# Altium schematic sheet Block_Bus_PC104.SchDoc
size A4; SheetNumber: 5; SheetTotal: 5
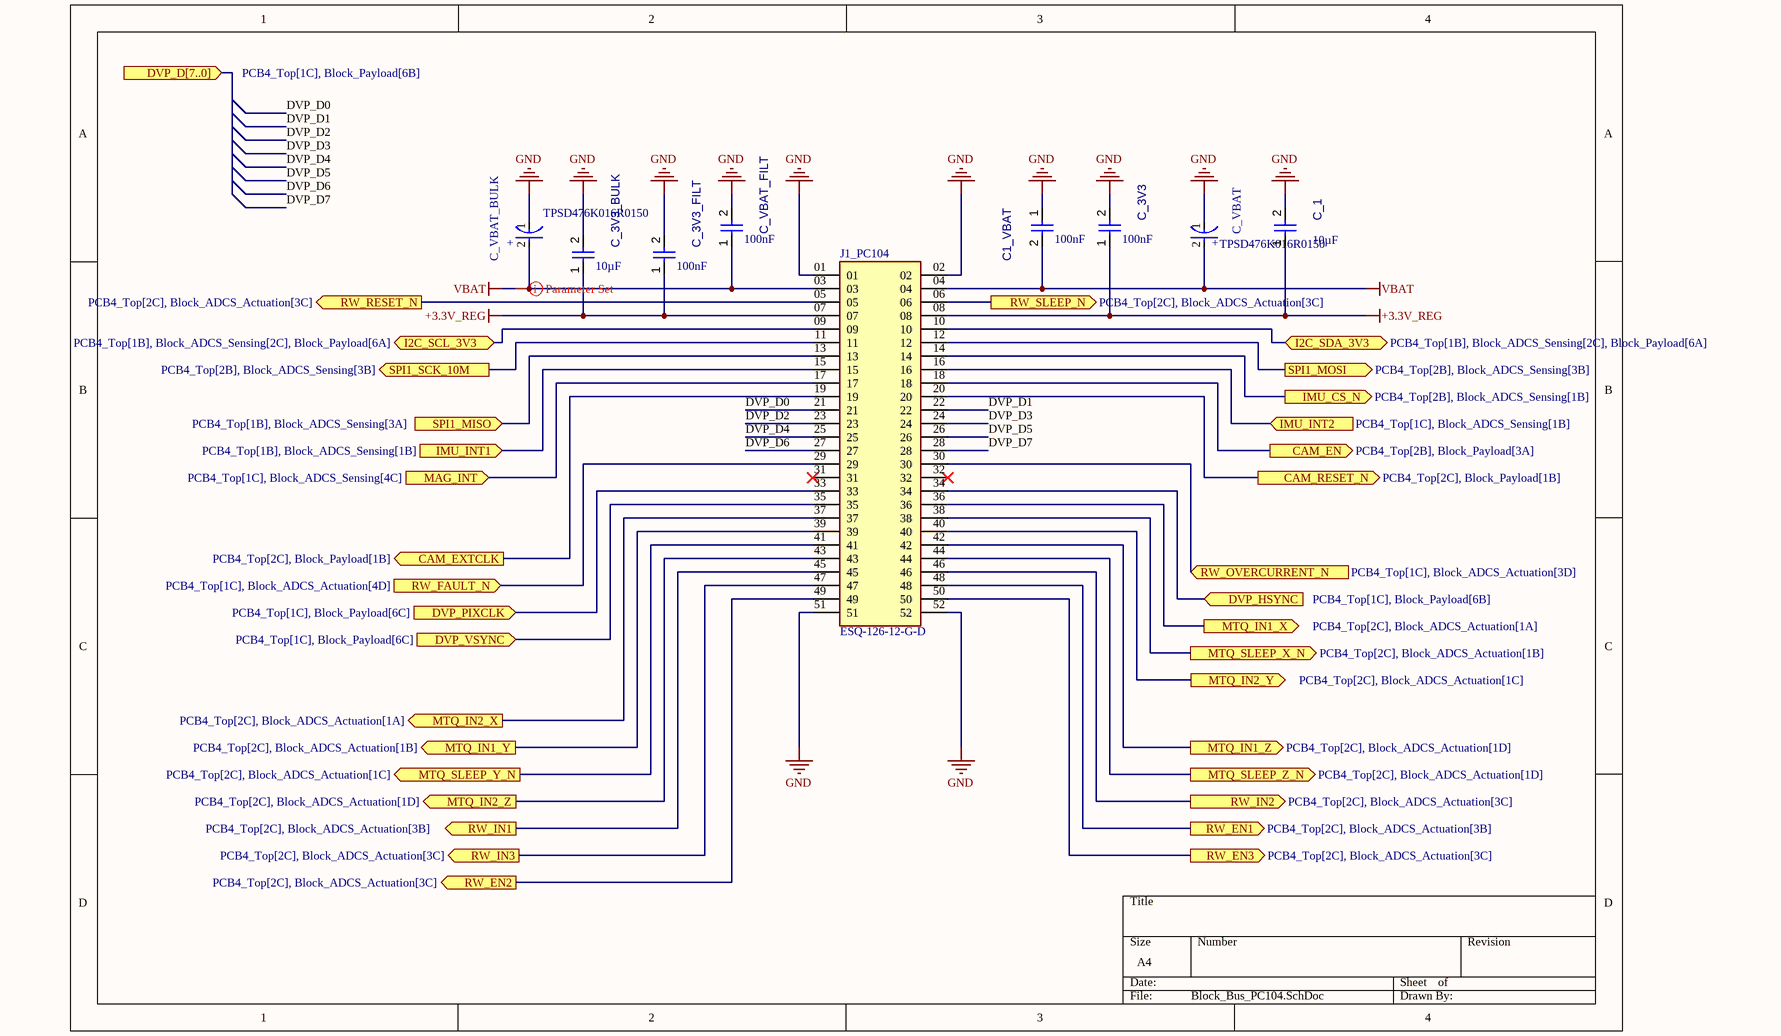
[diagram p0: Block_Bus_PC104.SchDoc]

## Parts
C1_VBAT  value 100nF  [CAPC1608X90X40NL10T20]  (hidden comment: Capacitor 100 nF +/-10% 50 V 0603)
C_1  value 10µF  [CAPC2013X135X45NL10T25]  (hidden comment: Capacitor 10 uF +/- 10% 16 V 0805)
C_3V3  value 100nF  [CAPC1608X90X40NL10T20]  (hidden comment: Capacitor 100 nF +/-10% 50 V 0603)
C_3V3_BULK  value 10µF  [CAPC2013X135X45NL10T25]  (hidden comment: Capacitor 10 uF +/- 10% 16 V 0805)
C_3V3_FILT  value 100nF  [CAPC1608X90X40NL10T20]  (hidden comment: Capacitor 100 nF +/-10% 50 V 0603)
C_VBAT  TPSD476K016R0150  [FP-TPSD-MFG]
C_VBAT_BULK  TPSD476K016R0150  [FP-TPSD-MFG]
C_VBAT_FILT  value 100nF  [CAPC1608X90X40NL10T20]  (hidden comment: Capacitor 100 nF +/-10% 50 V 0603)
J1_PC104  ESQ-126-12-G-D  [SAMTEC_ESQ-126-12-G-D]

## Ports
CAM_EN (out, see PCB4_Top[2B], Block_Payload[3A]), CAM_EXTCLK (out, see PCB4_Top[2C], Block_Payload[1B]), CAM_RESET_N (out, see PCB4_Top[2C], Block_Payload[1B]), DVP_D[7..0] (in, see PCB4_Top[1C], Block_Payload[6B]), DVP_HSYNC (in, see PCB4_Top[1C], Block_Payload[6B]), DVP_PIXCLK (in, see PCB4_Top[1C], Block_Payload[6C]), DVP_VSYNC (in, see PCB4_Top[1C], Block_Payload[6C]), I2C_SCL_3V3 (bidir, see PCB4_Top[1B], Block_ADCS_Sensing[2C], Block_Payload[6A]), I2C_SDA_3V3 (bidir, see PCB4_Top[1B], Block_ADCS_Sensing[2C], Block_Payload[6A]), IMU_CS_N (out, see PCB4_Top[2B], Block_ADCS_Sensing[1B]), IMU_INT1 (in, see PCB4_Top[1B], Block_ADCS_Sensing[1B]), IMU_INT2 (in, see PCB4_Top[1C], Block_ADCS_Sensing[1B]), MAG_INT (in, see PCB4_Top[1C], Block_ADCS_Sensing[4C]), MTQ_IN1_X (out, see PCB4_Top[2C], Block_ADCS_Actuation[1A]), MTQ_IN1_Y (out, see PCB4_Top[2C], Block_ADCS_Actuation[1B]), MTQ_IN1_Z (out, see PCB4_Top[2C], Block_ADCS_Actuation[1D]), MTQ_IN2_X (out, see PCB4_Top[2C], Block_ADCS_Actuation[1A]), MTQ_IN2_Y (out, see PCB4_Top[2C], Block_ADCS_Actuation[1C]), MTQ_IN2_Z (out, see PCB4_Top[2C], Block_ADCS_Actuation[1D]), MTQ_SLEEP_X_N (out, see PCB4_Top[2C], Block_ADCS_Actuation[1B]), MTQ_SLEEP_Y_N (out, see PCB4_Top[2C], Block_ADCS_Actuation[1C]), MTQ_SLEEP_Z_N (out, see PCB4_Top[2C], Block_ADCS_Actuation[1D]), RW_EN1 (out, see PCB4_Top[2C], Block_ADCS_Actuation[3B]), RW_EN2 (out, see PCB4_Top[2C], Block_ADCS_Actuation[3C]), RW_EN3 (out, see PCB4_Top[2C], Block_ADCS_Actuation[3C]), RW_FAULT_N (in, see PCB4_Top[1C], Block_ADCS_Actuation[4D]), RW_IN1 (out, see PCB4_Top[2C], Block_ADCS_Actuation[3B]), RW_IN2 (out, see PCB4_Top[2C], Block_ADCS_Actuation[3C]), RW_IN3 (out, see PCB4_Top[2C], Block_ADCS_Actuation[3C]), RW_OVERCURRENT_N (in, see PCB4_Top[1C], Block_ADCS_Actuation[3D]), RW_RESET_N (out, see PCB4_Top[2C], Block_ADCS_Actuation[3C]), RW_SLEEP_N (out, see PCB4_Top[2C], Block_ADCS_Actuation[3C]), SPI1_MISO (in, see PCB4_Top[1B], Block_ADCS_Sensing[3A]), SPI1_MOSI (out, see PCB4_Top[2B], Block_ADCS_Sensing[3B]), SPI1_SCK_10M (out, see PCB4_Top[2B], Block_ADCS_Sensing[3B])

## Nets
+3.3V_REG: C_1.1 C_3V3.1 C_3V3_BULK.1 C_3V3_FILT.1 J1_PC104.07 J1_PC104.08
GND: C1_VBAT.1 C_1.2 C_3V3.2 C_3V3_BULK.2 C_3V3_FILT.2 C_VBAT.1(C) C_VBAT_BULK.1(C) C_VBAT_FILT.2 J1_PC104.01 J1_PC104.02 J1_PC104.51 J1_PC104.52
VBAT: C1_VBAT.2 C_VBAT.2(A) C_VBAT_BULK.2(A) C_VBAT_FILT.1 J1_PC104.03 J1_PC104.04
CAM_EN: J1_PC104.18 ; port CAM_EN
CAM_EXTCLK: J1_PC104.19 ; port CAM_EXTCLK
CAM_RESET_N: J1_PC104.20 ; port CAM_RESET_N
DVP_D0: J1_PC104.21
DVP_D1: J1_PC104.22
DVP_D2: J1_PC104.23
DVP_D3: J1_PC104.24
DVP_D4: J1_PC104.25
DVP_D5: J1_PC104.26
DVP_D6: J1_PC104.27
DVP_D7: J1_PC104.28
DVP_HSYNC: J1_PC104.34 ; port DVP_HSYNC
DVP_PIXCLK: J1_PC104.33 ; port DVP_PIXCLK
DVP_VSYNC: J1_PC104.35 ; port DVP_VSYNC
I2C_SCL_3V3: J1_PC104.09 ; port I2C_SCL_3V3
I2C_SDA_3V3: J1_PC104.10 ; port I2C_SDA_3V3
IMU_CS_N: J1_PC104.14 ; port IMU_CS_N
IMU_INT1: J1_PC104.15 ; port IMU_INT1
IMU_INT2: J1_PC104.16 ; port IMU_INT2
MAG_INT: J1_PC104.17 ; port MAG_INT
MTQ_IN1_X: J1_PC104.36 ; port MTQ_IN1_X
MTQ_IN1_Y: J1_PC104.39 ; port MTQ_IN1_Y
MTQ_IN1_Z: J1_PC104.42 ; port MTQ_IN1_Z
MTQ_IN2_X: J1_PC104.37 ; port MTQ_IN2_X
MTQ_IN2_Y: J1_PC104.40 ; port MTQ_IN2_Y
MTQ_IN2_Z: J1_PC104.43 ; port MTQ_IN2_Z
MTQ_SLEEP_X_N: J1_PC104.38 ; port MTQ_SLEEP_X_N
MTQ_SLEEP_Y_N: J1_PC104.41 ; port MTQ_SLEEP_Y_N
MTQ_SLEEP_Z_N: J1_PC104.44 ; port MTQ_SLEEP_Z_N
RW_EN1: J1_PC104.48 ; port RW_EN1
RW_EN2: J1_PC104.49 ; port RW_EN2
RW_EN3: J1_PC104.50 ; port RW_EN3
RW_FAULT_N: J1_PC104.29 ; port RW_FAULT_N
RW_IN1: J1_PC104.45 ; port RW_IN1
RW_IN2: J1_PC104.46 ; port RW_IN2
RW_IN3: J1_PC104.47 ; port RW_IN3
RW_OVERCURRENT_N: J1_PC104.30 ; port RW_OVERCURRENT_N
RW_RESET_N: J1_PC104.05 ; port RW_RESET_N
RW_SLEEP_N: J1_PC104.06 ; port RW_SLEEP_N
SPI1_MISO: J1_PC104.13 ; port SPI1_MISO
SPI1_MOSI: J1_PC104.12 ; port SPI1_MOSI
SPI1_SCK_10M: J1_PC104.11 ; port SPI1_SCK_10M

Not connected (* = marked no-connect by the designer): J1_PC104 31* 32*

## Layout directives
rule Width Constraint [Pref Width = 31.496mil    Min Width = 23.622mil    Max Width = 59.055mil]: VBAT

## Notes on the sheet
- (in symbol CMP-2000-07306-2) +

## Library data of the parts
C1_VBAT C_3V3 C_3V3_FILT C_VBAT_FILT = CMP-001-00017-6: Chip Capacitor, 100 nF, +/- 10%, 50 V, 0603 (1608 Metric); Voltage Rating: 50V; Capacitor Type: Ceramic; Tolerance: 10%; Mounting Technology: SM; Max Operating Temperature: 125°C; RoHS Compliant: True; Pins: 2; Case/Package: 0603; Min Operating Temperature: -55°C
C_1 C_3V3_BULK = CMP-001-00015-6: Chip Capacitor, 10 uF, +/- 10%, 16 V, 0805 (2012 Metric); Voltage Rating: 16V; Capacitor Type: Ceramic; RoHS Compliant: True; Max Operating Temperature: 85°C; Min Operating Temperature: -55°C; Mounting Technology: SM; Tolerance: 10%; Case/Package: 0805; Pins: 2
C_VBAT C_VBAT_BULK = CMP-2000-07306-2: CAP TANT 47UF 10% 16V 2917; Leakage Current: 7.5uA; Dielectric Material: Tantalum; Ripple Current: 400uA; Approvals: IEC; Polarity: Polar; Dissipation Factor: 6%; ESR (Equivalent Series Resistance): 150mR; Lead Free: Lead Free; Capacitance: 47uF; Height: 2.9mm; Case Code (Imperial): 2917; RoHS Compliant: Yes; Voltage Rating: 16V; Min Operating Temperature: -55°C; REACH SVHC: No SVHC; Max Operating Temperature: 125°C; Construction: Flat; Series: TPS; Packaging: Tape and Reel; Number of Pins: 2; Features: General Purpose; Case Code (Metric): 7343; Package Quantity: 1; Mount: Surface Mount; Case/Package: 7343-31; Voltage Rating (DC): 16V; Length: 7.3mm; Radiation Hardening: No; Voltage: 16V; Height - Seated (Max): 0.122inch; Termination: SMD/SMT; Depth: 4.3mm; Width: 0.169inch; Tolerance: 10%
J1_PC104 = ESQ-126-12-G-D: Availability: Unavailable; Package: None; Price: None; MP: ESQ-126-12-G-D; Value: *